# Altium schematic sheet USBC_DRP.SchDoc: Skipper USBC DRP
size 297 x 210 mm; Author: Jack Herron; SheetNumber: 6; SheetTotal: 11
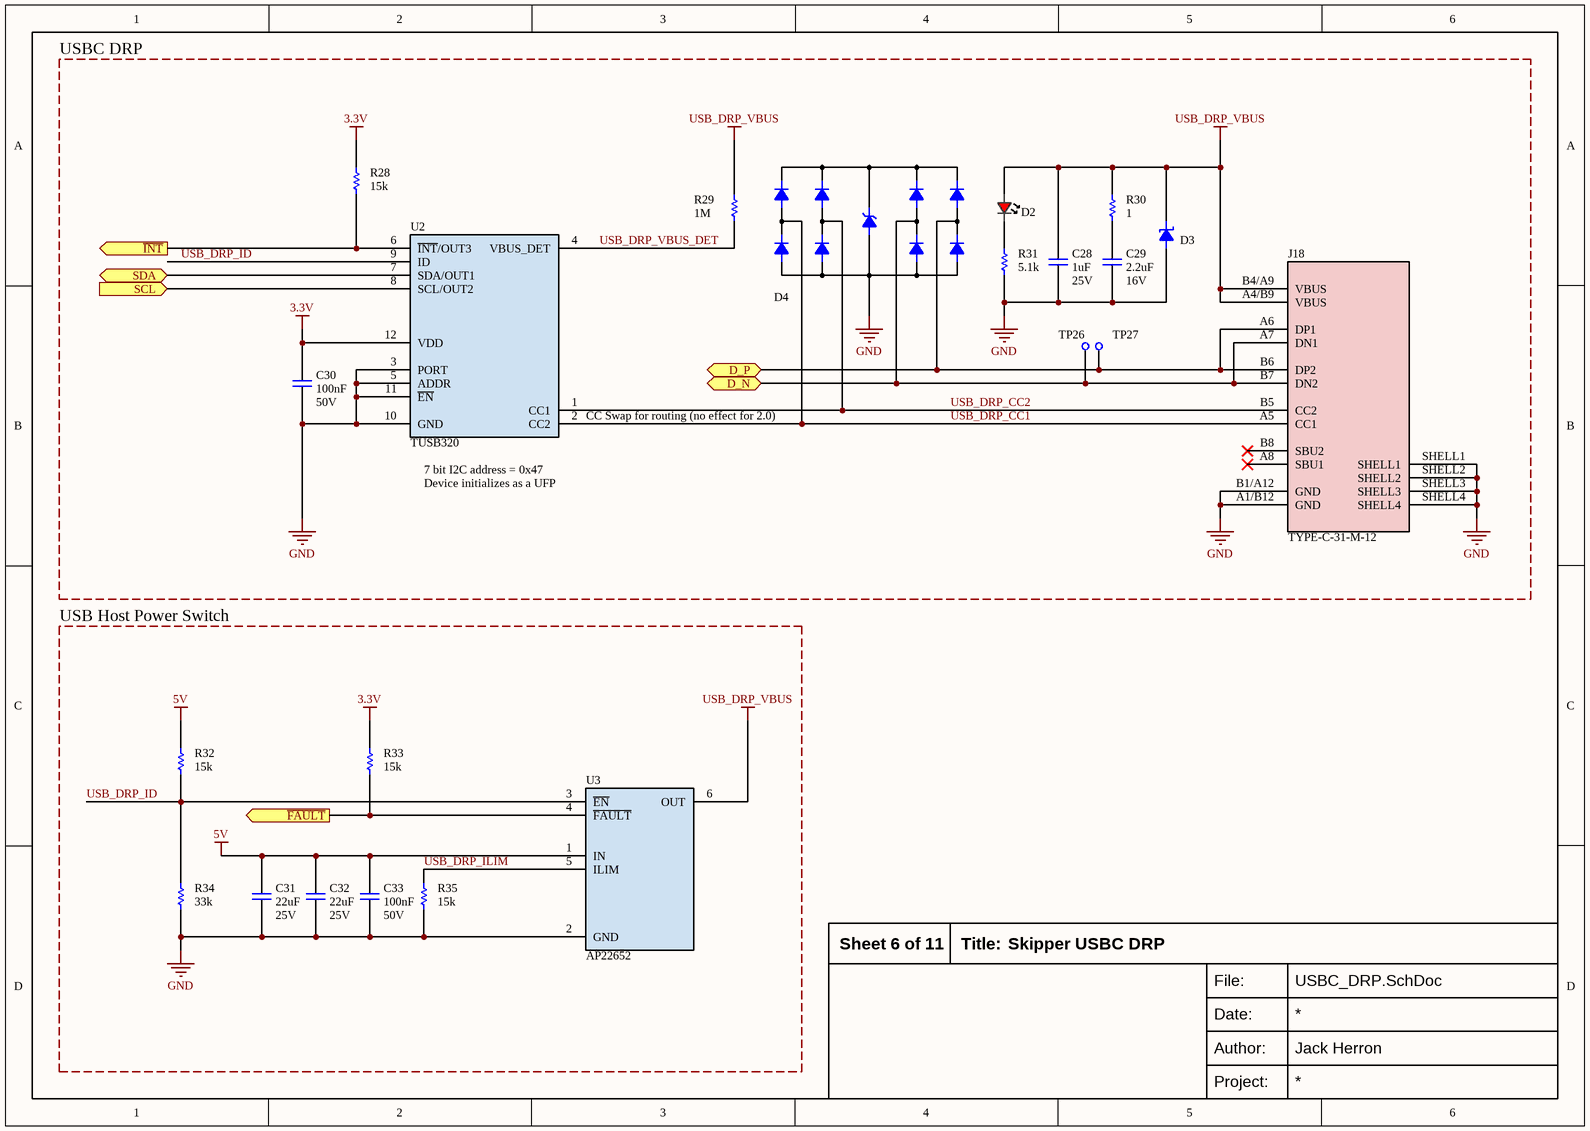
[diagram p0: USBC_DRP.SchDoc]

## Parts
C28  value 1uF  Voltage: 25V  [CAPACITOR-0402]  (hidden comment: CL05A105KA5NQNC)
C29  value 2.2uF  Voltage: 16V  [CAPACITOR-0603]  (hidden comment: CL10A225KO8NNNC)
C30  value 100nF  Voltage: 50V  [CAPACITOR-0402]  (hidden comment: CL05B104KB54PNC)
C31  value 22uF  Voltage: 25V  [CAPACITOR-1206]  (hidden comment: CL31A226KAHNNNE)
C32  value 22uF  Voltage: 25V  [CAPACITOR-1206]  (hidden comment: CL31A226KAHNNNE)
C33  value 100nF  Voltage: 50V  [CAPACITOR-0402]  (hidden comment: CL05B104KB54PNC)
D2  KT-0603R  [LED-0603]  (value not drawn)
D3  SMF5.0A  [DIODE-SOD-123FL]  (value not drawn)
D4  TPD4E1U06DBVR-TP  [SOT23-6]  (value not drawn)
J18  TYPE-C-31-M-12  [CONNECTOR_USBC_TYPE-C-31-M-12]
R28  value 15k  [RESISTOR-0402]  (hidden comment: 0402WGF1502TCE)
R29  value 1M  [RESISTOR-0402]  (hidden comment: 0402WGF1004TCE)
R30  value 1  [RESISTOR-0603]  (hidden comment: 0603WAF100KT5E)
R31  value 5.1k  [RESISTOR-0402]  (hidden comment: 0402WGF5101TCE)
R32  value 15k  [RESISTOR-0402]  (hidden comment: 0402WGF1502TCE)
R33  value 15k  [RESISTOR-0402]  (hidden comment: 0402WGF1502TCE)
R34  value 33k  [RESISTOR-0402]  (hidden comment: 0402WGF3302TCE)
R35  value 15k  [RESISTOR-0402]  (hidden comment: 0402WGF1502TCE)
TP26  RH-5019  [TESTPOINT_RH-5019]  (value not drawn)
TP27  RH-5019  [TESTPOINT_RH-5019]  (value not drawn)
U2  TUSB320  [RWB0012A]
U3  AP22652  [SOT23-6]

## Blocks framed on the sheet
USBC DRP: C28-C30 D2-D4 J18 R28-R31 TP26 TP27 U2
USB Host Power Switch: C31-C33 R32-R35 U3

## Ports
D_N (bidir, see Top_Sheet[1C]), D_P (bidir, see Top_Sheet[1C]), SCL (in, see Top_Sheet[1C]), SDA (bidir, see Top_Sheet[1C]), ~{FAULT} (out, see Top_Sheet[2C]), ~{INT} (out, see Top_Sheet[1C])

## Nets
3.3V: C30.2 R28.2 R33.2 U2.12(VDD)
5V: C31.2 C32.2 C33.2 R32.2 U3.1(IN)
GND: C28.1 C29.1 C30.1 C31.1 C32.1 C33.1 D3.A D4.2 J18.A1/B12(GND) J18.B1/A12(GND) J18.SHELL1 J18.SHELL2 J18.SHELL3 J18.SHELL4 R31.1 R34.1 R35.1 U2.3(PORT) U2.5(ADDR) U2.10(GND) U2.11(~{EN}) U3.2(GND)
USB_DRP_VBUS: C28.2 D2.A D3.K J18.A4/B9(VBUS) J18.B4/A9(VBUS) R29.2 R30.2 U3.6(OUT)
D_N: D4.4 J18.A7(DN1) J18.B7(DN2) TP26.1 ; port D_N
D_P: D4.6 J18.A6(DP1) J18.B6(DP2) TP27.1 ; port D_P
~{FAULT}: R33.1 U3.4(~{FAULT}) ; port ~{FAULT}
~{INT}: R28.1 U2.6(~{INT}/OUT3) ; port ~{INT}
SCL: U2.8(SCL/OUT2) ; port SCL
SDA: U2.7(SDA/OUT1) ; port SDA
USB_DRP_CC1: D4.1 J18.A5(CC1) U2.2(CC2)
USB_DRP_CC2: D4.3 J18.B5(CC2) U2.1(CC1)
USB_DRP_ID: R32.1 R34.2 U2.9(ID) U3.3(~{EN})
USB_DRP_ILIM: R35.2 U3.5(ILIM)
USB_DRP_VBUS_DET: R29.1 U2.4(VBUS_DET)
NetC29_2: C29.2 R30.1
NetD2_K: D2.K R31.2

Not connected (* = marked no-connect by the designer): J18 A8(SBU1)* B8(SBU2)*

## Notes on the sheet
- (near U2) 7 bit I2C address = 0x47
- (near U2) CC Swap for routing (no effect for 2.0)
- Device initializes as a UFP
- Title:
- File:
- Date:
- Project:
- Author:

## Library data of the parts
C28 = CAPACITOR_CL05A105KA5NQNC: Capacitor - 1uF - 25V - 0402 - X5R; Manufacturer 1: Samsung; Manufacturer Part Number 1: CL05A105KA5NQNC; Supplier 1: LCSC; Supplier Part Number 1: C52923
C29 = CAPACITOR_CL10A225KO8NNNC: Capacitor - 2.2uF - 16V - 0603 - X5R; Manufacturer 1: Samsung; Manufacturer Part Number 1: CL10A225KO8NNNC; Supplier 1: LCSC; Supplier Part Number 1: C23630
C30 C33 = CAPACITOR_CL05B104KB54PNC: Capacitor - 100nF - 50V - 0402 - X7R; Manufacturer 1: Samsung; Manufacturer Part Number 1: CL05B104KB54PNC; Supplier 1: LCSC; Supplier Part Number 1: C307331
C31 C32 = CAPACITOR_CL31A226KAHNNNE: Capacitor - 22uF - 25V - 1206; Manufacturer 1: Samsung; Manufacturer Part Number 1: CL31A226KAHNNNE; Supplier 1: LCSC; Supplier Part Number 1: C12891
D2 = LED_KT-0603R: LED - Red - 0603; Manufacturer 1: Hubei KENTO Elec; Manufacturer Part Number 1: KT-0603R; Supplier 1: LCSC; Supplier Part Number 1: C2286
D3 = DIODE_TVS_UNIDIRECTIONAL_5-7-9.2V_SMF5.0A: TVS Diode 5V standoff, 7V breakdown, 9.2V clamp; Manufacturer 1: Littelfuse; Manufacturer Part Number 1: SMF5.0A; Supplier 1: LCSC; Supplier Part Number 1: C151296
D4 = ESD-ARRAY_4-Channel_TPD4E1U06DBVR-TP: Diode - TVS - USB ESD Protection - SOT23-6; Manufacturer 1: Tech Public; Manufacturer Part Number 1: TPD4E1U06DBVR-TP; Supplier 1: LCSC; Supplier Part Number 1: C2841427
J18 = CONNECTOR_USBC_TYPE-C-31-M-12: USB Recepticle - Type-C; Manufacturer 1: Korean Hroparts Elec; Manufacturer Part Number 1: TYPE-C-31-M-12; Supplier 1: LCSC; Supplier Part Number 1: C165948
R28 R32 R33 R35 = RESISTOR_0402WGF1502TCE: Resistor - 15k - 0402; Manufacturer 1: UNI-ROYAL; Voltage: 50V; Wattage: 62.5mW; Manufacturer Part Number 1: 0402WGF1502TCE; Supplier 1: LCSC; Supplier Part Number 1: C25756
R29 = RESISTOR_0402WGF1004TCE: Resistor - 1M - 0402; Manufacturer 1: UNI-ROYAL; Voltage: 50V; Wattage: 62.5mW; Manufacturer Part Number 1: 0402WGF1004TCE; Supplier 1: LCSC; Supplier Part Number 1: C26083
R30 = RESISTOR_0603WAF100KT5E: Resistor - 1 - 0603; Manufacturer 1: UNI-ROYAL; Voltage: 75V; Wattage: 100mW; Manufacturer Part Number 1: 0603WAF100KT5E; Supplier 1: LCSC; Supplier Part Number 1: C22936
R31 = RESISTOR_0402WGF5101TCE: Resistor - 5.1k - 0402; Manufacturer 1: UNI-ROYAL; Voltage: 50V; Wattage: 62.5mW; Manufacturer Part Number 1: 0402WGF5101TCE; Supplier 1: LCSC; Supplier Part Number 1: C25905
R34 = RESISTOR_0402WGF3302TCE: Resistor - 33k - 0402; Manufacturer 1: UNI-ROYAL; Voltage: 50V; Wattage: 62.5mW; Supplier 1: LCSC; Supplier Part Number 1: C25779; Manufacturer Part Number 1: 0402WGF3302TCE
TP26 TP27 = TESTPOINT_RH-5019: SMD testpoint; Manufacturer 1: ronghe; Manufacturer Part Number 1: RH-5019; Supplier 1: LCSC; Supplier Part Number 1: C5199800
U2 = INTERFACE_USBC-Port-Controller_TUSB320: USBC power port controller; Manufacturer 1: Texas Instruments; Manufacturer Part Number 1: TUSB320LAIRWBR; Supplier 1: LCSC; Supplier Part Number 1: C132554
U3 = POWER-SWITCH_ AP22652: Active low USB power switch; Manufacturer 1: Diodes Inc.; Manufacturer Part Number 1: AP22652W6-7; Supplier 1: LCSC; Supplier Part Number 1: C2158038